# Altium schematic sheet Sheet1.SchDoc
size 420 x 297 mm; SheetNumber: 1; SheetTotal: 1
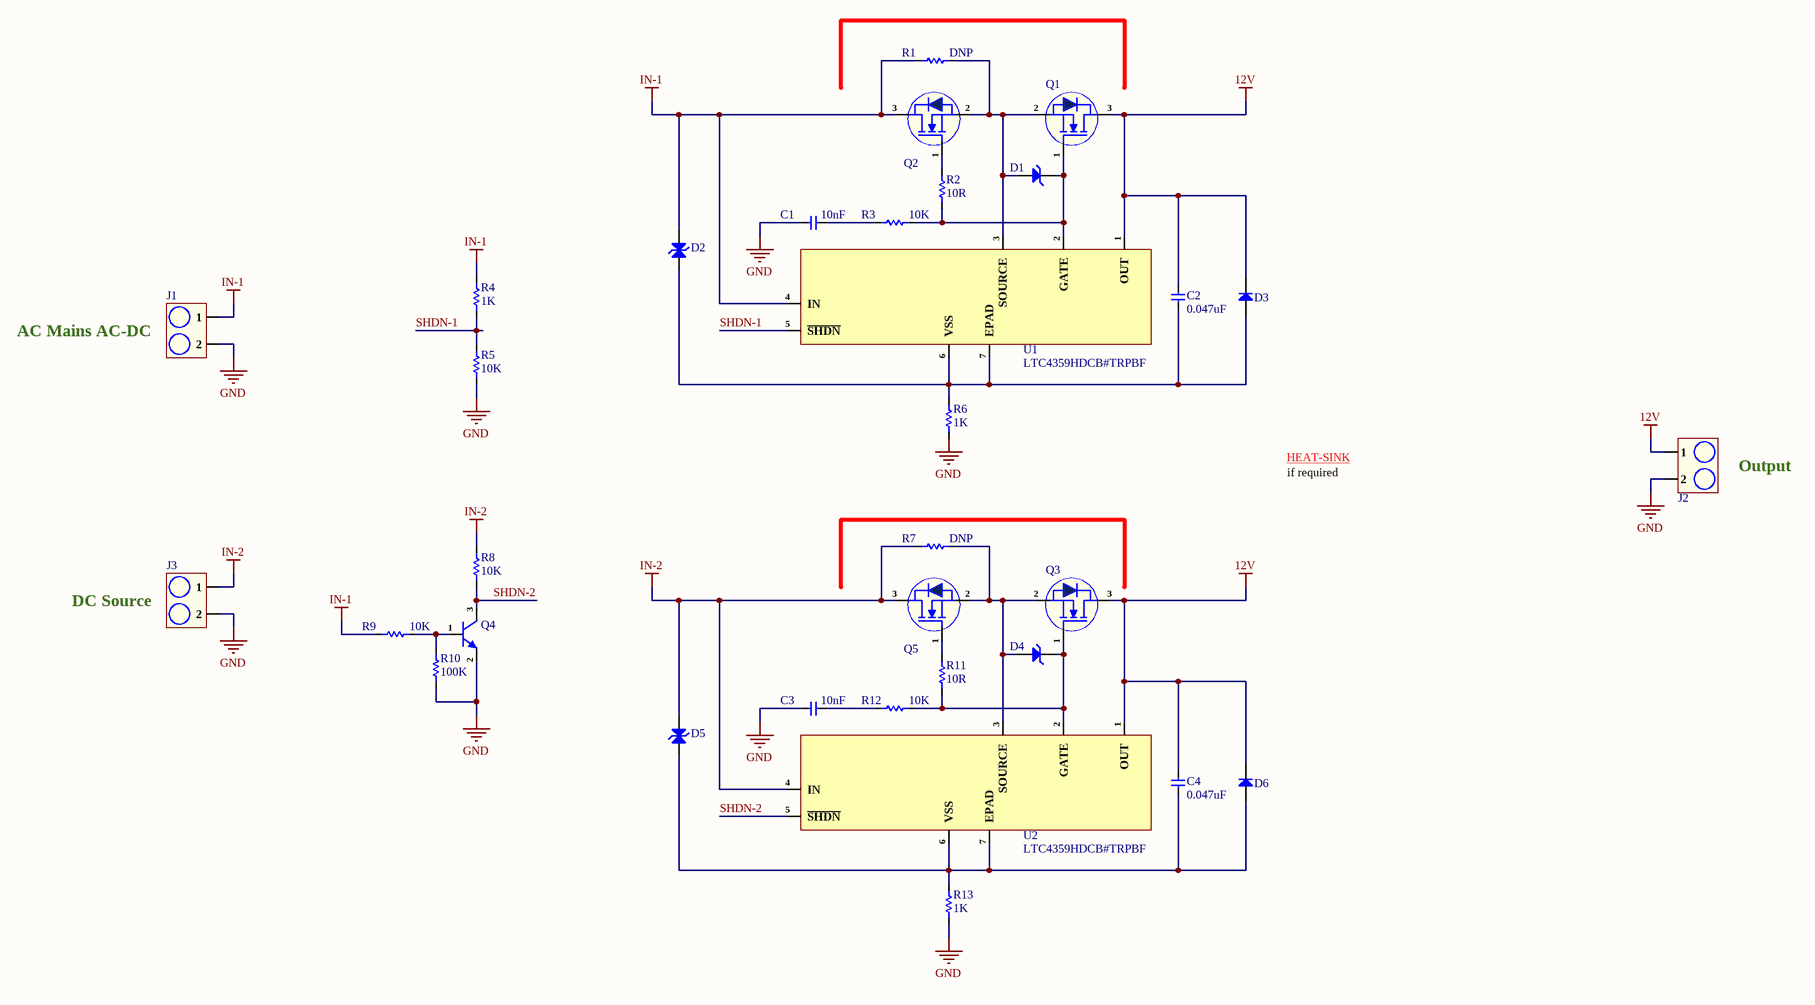
[diagram p0: Sheet1.SchDoc]

## Parts
C1  10nF  [Cap-0402]
C2  0.047uF  [Cap-1206]
C3  10nF  [Cap-0402]
C4  0.047uF  [Cap-1206]
D1  MMSZ5242BS-7-F  [SOD-323]  (value not drawn)
D2  SMAJ24CA  [SMA Bi Directional]  (value not drawn)
D3  S1B-13-F  [SMA(DO-214AC)]  (value not drawn)
D4  MMSZ5242BS-7-F  [SOD-323]  (value not drawn)
D5  SMAJ24CA  [SMA Bi Directional]  (value not drawn)
D6  S1B-13-F  [SMA(DO-214AC)]  (value not drawn)
J1  KF78C-13.0-2P  [KF78C-13.0-2P]  (value not drawn)
J2  KF78C-13.0-2P  [KF78C-13.0-2P]  (value not drawn)
J3  KF78C-13.0-2P  [KF78C-13.0-2P]  (value not drawn)
Q1  AOTL66912  [Tolla]  (value not drawn)
Q2  AOTL66912  [Tolla]  (value not drawn)
Q3  AOTL66912  [Tolla]  (value not drawn)
Q4  MMBTA06-7-F  [SOT-23]  (value not drawn)
Q5  AOTL66912  [Tolla]  (value not drawn)
R1  DNP  [Res-0603]  (no BOM)
R2  10R  [Res-0603]
R3  10K  [Res-0603]
R4  1K  [Res-0603]
R5  10K  [Res-0603]
R6  1K  [Res-0603]
R7  DNP  [Res-0603]  (no BOM)
R8  10K  [Res-0603]
R9  10K  [Res-0603]
R10  100K  [Res-0603]
R11  10R  [Res-0603]
R12  10K  [Res-0603]
R13  1K  [Res-0603]
U1  LTC4359HDCB#TRPBF  [DFN-6-EP(2x3)]
U2  LTC4359HDCB#TRPBF  [DFN-6-EP(2x3)]

## Nets
12V: C2.2 C4.2 D3.1(K) D6.1(K) J2.1 Q1.3(D) Q3.3(D) U1.1(OUT) U2.1(OUT)
GND: C1.1 C3.1 J1.2 J2.2 J3.2 Q4.2(E) R5.1 R6.1 R10.1 R13.1
IN-1: D2.2(K) J1.1 Q2.3(D) R1.2 R4.2 R9.2 U1.4(IN)
IN-2: D5.2(K) J3.1 Q5.3(D) R7.2 R8.1 U2.4(IN)
SHDN-1: R4.1 R5.2 U1.5(~{SHDN})
SHDN-2: Q4.3(C) R8.2 U2.5(~{SHDN})
NetC1_2: C1.2 R3.1
NetC2_1: C2.1 D2.1(A) D3.2(A) R6.2 U1.6(VSS) U1.7(EPAD)
NetC3_2: C3.2 R12.1
NetC4_1: C4.1 D5.1(A) D6.2(A) R13.2 U2.6(VSS) U2.7(EPAD)
NetD1_1: D1.1(K) Q1.1(G) R2.1 R3.2 U1.2(GATE)
NetD1_2: D1.2(A) Q1.2(S) Q2.2(S) R1.1 U1.3(SOURCE)
NetD4_1: D4.1(K) Q3.1(G) R11.1 R12.2 U2.2(GATE)
NetD4_2: D4.2(A) Q3.2(S) Q5.2(S) R7.1 U2.3(SOURCE)
NetQ2_1: Q2.1(G) R2.2
NetQ4_1: Q4.1(B) R9.1 R10.2
NetQ5_1: Q5.1(G) R11.2

## Notes on the sheet
- AC Mains AC-DC
- HEAT-SINK <https://lcsc.com/product-detail/Heat-sink-cooling-fin_XSD-XSD183-097-B_C286209.html>
- if required
- Output
- DC Source
- ZyntelliTech
- File:
- Title:
- Date:
- Page
- Num:
- Total:
- Drawn By: Huzaifa Ali

## Library data of the parts
C1 C3 = CC0402KRX7R0BB103: CAP CER 10000PF 100V X7R 0402; Manufacturer: Yageo; Item Type: Capacitors; Material: Ceramic; Tolerance: 10%; Supplier: Arrow Electronics; LCSC Part Number: C527014; Manufacturer Part Number: CC0402KRX7R0BB103; RoHS: Yes; Stock: 60000; Pricing: 10000=0.0098, 20000=0.0097, 30000=0.0092, 50000=0.0091, 100000=0.009, 250000=0.0089 (USD); Case/Package: 0402; Min Operating Temperature: -55°C; Max Operating Temperature: 125°C; Value: 10nF; Voltage Rating: 100V; Height: 550um; RoHS Compliant: Yes; ComponentLink1URL: https://datasheet.octopart.com/CC0402KRX7R0BB103-Yageo-datasheet-166511530.pdf?src-supplier=Future+Electronics; ComponentLink1Description: https://datasheet.octopart.com/CC0402KRX7R0BB103-Yageo-datasheet-166511530.pdf?src-supplier=Future+Electronics; ComponentLink2URL: https://datasheet.octopart.com/CC0402KRX7R0BB103-Yageo-datasheet-153410991.pdf?src-supplier=Farnell; ComponentLink2Description: https://datasheet.octopart.com/CC0402KRX7R0BB103-Yageo-datasheet-153410991.pdf?src-supplier=Farnell
C2 C4 = CC1206JRX7R0BB473: CAP CER 0.047UF 100V X7R 1206; Manufacturer: Yageo; Tolerance: 5%; Capacitance: 47nF; Item Type: Capacitor; Supplier 1: Arrow Electronics; Manufacturer Part Number: CC1206JRX7R0BB473; RoHS: Yes; Category: Ceramic Capacitors; Stock 1: 6600; Pricing 1: 1=0.21620, 10=0.10530, 25=0.10420, 100=0.08480, 250=0.08390, 500=0.05860, 1000=0.05090, 3000=0.04900, 6000=0.02930 (USD); Mount: Surface Mount; Case/Package: 1206; Case Code (Imperial): 1206; Case Code (Metric): 3216; Min Operating Temperature: -55°C; Max Operating Temperature: 125°C; Packaging: Tape and Reel; Voltage Rating (DC): 100V; Dielectric: X7R; Termination: SMD/SMT; Resistor Type: Ceramic; Voltage Rating: 100V; Series: CC; Construction: Flat; Length: 3.2mm; Width: 1.6mm; Height: 0.85mm; Thickness: 0.037inch; Depth: 1.6mm; Radiation Hardening: No; RoHS Compliant: Yes; ComponentLink1URL: https://datasheet.ciiva.com/11465/upy-np0x7r-mv-100-to-630v-9-11465413.pdf?src-supplier=Avnet; ComponentLink1Description: https://datasheet.ciiva.com/11465/upy-np0x7r-mv-100-to-630v-9-11465413.pdf?src-supplier=Avnet; ComponentLink2URL: https://datasheet.ciiva.com/13210/upy-gp-np0-16v-to-50v-8-13210277.pdf?src-supplier=Mouser; ComponentLink2Description: https://datasheet.ciiva.com/13210/upy-gp-np0-16v-to-50v-8-13210277.pdf?src-supplier=Mouser; Supplier Part Number 1: CC1206JRX7R0BB473; LCSC Part Number: C577197
D1 D4 = MMSZ5242BS-7-F: DIODE ZENER 12V 200MW SOD323; Manufacturer: Diodes; Supplier: Future Electronics; LCSC Part Number: C151457; Manufacturer Part Number: MMSZ5242BS-7-F; RoHS: Yes; Item Type: Diodes; Stock: 15000; Pricing: 3000=0.0228, 9000=0.022, 15000=0.0216, 60000=0.0206, 90000=0.02 (USD); ComponentLink1URL: https://datasheet.ciiva.com/4734/ds31038-62930-4734288.pdf?src-supplier=Mouser; ComponentLink1Description: https://datasheet.ciiva.com/4734/ds31038-62930-4734288.pdf?src-supplier=Mouser; ComponentLink2URL: https://datasheet.ciiva.com/892/ds31038-892105.pdf?src-supplier=Digikey; ComponentLink2Description: https://datasheet.ciiva.com/892/ds31038-892105.pdf?src-supplier=Digikey; ComponentLink3URL: https://datasheet.ciiva.com/892/ds31038-892106.pdf?src-supplier=Digikey; ComponentLink3Description: https://datasheet.ciiva.com/892/ds31038-892106.pdf?src-supplier=Digikey; ComponentLink4URL: https://datasheet.ciiva.com/892/ds31038-892107.pdf?src-supplier=Digikey; ComponentLink4Description: https://datasheet.ciiva.com/892/ds31038-892107.pdf?src-supplier=Digikey; ComponentLink5URL: https://datasheet.ciiva.com/8347/ds31038-8347977.pdf?src-supplier=Avnet; ComponentLink5Description: https://datasheet.ciiva.com/8347/ds31038-8347977.pdf?src-supplier=Avnet
D2 D5 = SMAJ24CA: TVS DIODE 24VWM 38.9VC DO214AC; Manufacturer: Littelfuse; Item Type: TVS Diodes; Peak Pulse Power: 400W; Reverse Standoff Voltage: 24V; Min Breakdown Voltage: 26.7V; Peak Pulse Current: 10.3A; Polarity: Bidirectional; Clamping Voltage: 38.9V; Test Current: 1mA; Number of Bidirectional Channels: 1; Power Line Protection: No; Max Power Dissipation: 3.3W; Leakage Current: 1uA; Diode Type: ZENER; Max Breakdown Voltage: 29.5V; Supplier: Digikey; LCSC Part Number: C148223; Manufacturer Part Number: SMAJ24CA; RoHS: Yes; Stock: 31613; Pricing: 1=0.31, 10=0.21, 100=0.104, 500=0.1, 1000=0.099, 2000=0.09895 (USD); Mounting Technology: Surface Mount; Case/Package: DO-214AC; Pins: 2; Min Operating Temperature: -65°C; Max Operating Temperature: 150°C; Packaging: Tape and Reel; Series: SMAJ; Direction: Bidirectional; Reverse Breakdown Voltage: 26.7V; Number of Elements: 1; Voltage Rating (DC): 24V; Max Reverse Leakage Current: 1uA; Power Dissipation: 400W; Clamping Voltage-Max: 38.9V; Reverse Voltage: 24V; Length: 5.28mm; Width: 2.79mm; Height: 2.29mm; RoHS Compliant: Yes; Lead Free: Lead Free; Reach SVHC Compliant: No; ComponentLink1URL: https://datasheet.ciiva.com/28473/607617-28473406.pdf?src-supplier=Element14; ComponentLink1Description: https://datasheet.ciiva.com/28473/607617-28473406.pdf?src-supplier=Element14; ComponentLink2URL: https://datasheet.ciiva.com/331/littelfuse-tvs-diode-smaj-datasheet-pdf-331049.pdf?src-supplier=Digikey; ComponentLink2Description: https://datasheet.ciiva.com/331/littelfuse-tvs-diode-smaj-datasheet-pdf-331049.pdf?src-supplier=Digikey; ComponentLink3URL: https://datasheet.ciiva.com/331/littelfuse-tvs-diode-smaj-datasheet-pdf-331050.pdf?src-supplier=Digikey; ComponentLink3Description: https://datasheet.ciiva.com/331/littelfuse-tvs-diode-smaj-datasheet-pdf-331050.pdf?src-supplier=Digikey; ComponentLink4URL: https://datasheet.ciiva.com/331/littelfuse-tvs-diode-smaj-datasheet-pdf-331048.pdf?src-supplier=Digikey; ComponentLink4Description: https://datasheet.ciiva.com/331/littelfuse-tvs-diode-smaj-datasheet-pdf-331048.pdf?src-supplier=Digikey
D3 D6 = S1B-13-F: DIODE STANDARD 100V 1A SMA; Manufacturer: Diodes; Supplier: Future Electronics; LCSC Part Number: C156295; Manufacturer Part Number: S1B-13-F; RoHS: Yes; Item Type: Diodes; Stock: 350000; Pricing: 5000=0.0176, 15000=0.0172, 25000=0.017, 100000=0.0165, 150000=0.0162 (USD); ComponentLink1URL: https://datasheet.ciiva.com/911/ds16003-911864.pdf?src-supplier=Digikey; ComponentLink1Description: https://datasheet.ciiva.com/911/ds16003-911864.pdf?src-supplier=Digikey; ComponentLink2URL: https://datasheet.ciiva.com/911/ds16003-911865.pdf?src-supplier=Digikey; ComponentLink2Description: https://datasheet.ciiva.com/911/ds16003-911865.pdf?src-supplier=Digikey; ComponentLink3URL: https://datasheet.ciiva.com/911/ds16003-911866.pdf?src-supplier=Digikey; ComponentLink3Description: https://datasheet.ciiva.com/911/ds16003-911866.pdf?src-supplier=Digikey
J1-J3 = KF78C-13.0-2P: 1x2P Midfoot Barrier Block 2 1 13mm 40A -40℃~+105℃ 750V Black 10~18 Straight pin 6 Plugin,P=13mm Barrier Terminal Blocks ROHS; Manufacturer: CiXi KaiFeng Electronics; Supplier: LCSC; LCSC Part Number: C707721; Manufacturer Part Number: KF78C-13.0-2P; RoHS: No; Item Type: Terminal Block
Q1-Q3 Q5 = AOTL66912: MOSFET N-CH 100V 49A/380A TOLLA; Manufacturer: Alpha & Omega Semiconductor; Continuous Drain Current (ID): 380A; Drain to Source Resistance: 1.4mR; Gate to Source Voltage (Vgs): 20V; Number of Channels: 1NUMBER; Power Dissipation: 8.3W; Turn-Off Delay Time: 90ns; Turn-On Delay Time: 36ns; Supplier: Digikey; LCSC Part Number: C3291324; Manufacturer Part Number: AOTL66912; RoHS: Yes; Item Type: MOSFET; Stock: 5626; Pricing: 1=7.98, 10=5.427, 100=4.1846 (USD); Min Operating Temperature: -55°C; Max Operating Temperature: 175°C; Drain to Source Breakdown Voltage: 100V; Drain to Source Voltage (Vdss): 100V; Height: 2.4mm
Q4 = MMBTA06-7-F: TRANS NPN 80V 0.5A SOT23-3; Manufacturer: Diodes; Item Type: BJTs; Current Rating: 500mA; Supplier: Future Electronics; LCSC Part Number: C151597; Manufacturer Part Number: MMBTA06-7-F; RoHS: Yes; Stock: 573000; Pricing: 3000=0.021, 9000=0.0202, 30000=0.0194, 60000=0.019, 120000=0.0182 (USD); Voltage Rating (DC): 80V; Lead Free: 5697LeadFree; ComponentLink1URL: https://datasheet.ciiva.com/19482/1540800-19482686.pdf?src-supplier=Jameco; ComponentLink1Description: https://datasheet.ciiva.com/19482/1540800-19482686.pdf?src-supplier=Jameco; ComponentLink2URL: https://datasheet.ciiva.com/15139/getdatasheetpartid-116057-15139325.pdf?src-supplier=Verical; ComponentLink2Description: https://datasheet.ciiva.com/15139/getdatasheetpartid-116057-15139325.pdf?src-supplier=Verical; ComponentLink3URL: https://datasheet.ciiva.com/972/ds30037-972971.pdf?src-supplier=Digikey; ComponentLink3Description: https://datasheet.ciiva.com/972/ds30037-972971.pdf?src-supplier=Digikey; ComponentLink4URL: https://datasheet.ciiva.com/972/ds30037-972972.pdf?src-supplier=Digikey; ComponentLink4Description: https://datasheet.ciiva.com/972/ds30037-972972.pdf?src-supplier=Digikey; ComponentLink5URL: https://datasheet.ciiva.com/972/ds30037-972973.pdf?src-supplier=Digikey; ComponentLink5Description: https://datasheet.ciiva.com/972/ds30037-972973.pdf?src-supplier=Digikey; ComponentLink6URL: https://datasheet.ciiva.com/11197/ds30037-11197413.pdf?src-supplier=Avnet; ComponentLink6Description: https://datasheet.ciiva.com/11197/ds30037-11197413.pdf?src-supplier=Avnet; ComponentLink7URL: https://datasheet.ciiva.com/4723/ds30037-4723212.pdf?src-supplier=Mouser; ComponentLink7Description: https://datasheet.ciiva.com/4723/ds30037-4723212.pdf?src-supplier=Mouser; ComponentLink8URL: https://datasheet.ciiva.com/22711/1915521-22711756.pdf?src-supplier=Element14; ComponentLink8Description: https://datasheet.ciiva.com/22711/1915521-22711756.pdf?src-supplier=Element14; ComponentLink9URL: https://datasheet.ciiva.com/16298/ds30037-16298441.pdf?src-supplier=Future+Electronics; ComponentLink9Description: https://datasheet.ciiva.com/16298/ds30037-16298441.pdf?src-supplier=Future+Electronics
R1 R7 R10 = RC0603FR-07100KL: RES 100K OHM 1% 1/10W 0603; Manufacturer: Yageo; Item Type: Resistors; Value: 100kR; Temperature Coefficient: 100ppm/°C; Voltage Rating (DC): 50V; Power Rating: 100mW; Supplier: Rs; LCSC Part Number: C14675; Manufacturer Part Number: RC0603FR-07100KL; RoHS: Yes; Stock: 27300; Case/Package: 0603; Pins: 2; Case Code (Imperial): 0603; Case Code (Metric): 1608; Min Operating Temperature: -55°C; Max Operating Temperature: 155°C; Tolerance: 1%; Resistor Type: Thick Film; Packaging: Tape and Reel; Voltage Rating: 50V; Termination: SMD/SMT; Number of Terminations: 2; Features: Moisture Resistant; Series: RC; Max Power Dissipation: 100mW; Resistance Tolerance: 1%; Construction: Rectangular; Technology: THICK FILM; Length: 1.6mm; Width: 0.8mm; Height: 0.45mm; Depth: 0.8mm; Reach SVHC Compliant: No; Lead Free: 5697LeadFree; Military Standard: Not; RoHS Compliant: Yes; Supplier Part Number: 2424020; Category: Chip SMD Resistors; Mounting Technology: Surface Mount; Weight: 7.1E-05oz; Package Quantity: 5000; ComponentLink1URL: https://datasheet.ciiva.com/11819/0900766b80f96399-11819227.pdf?src-supplier=Rs; ComponentLink1Description: https://datasheet.ciiva.com/11819/0900766b80f96399-11819227.pdf?src-supplier=Rs; ComponentLink2URL: https://datasheet.ciiva.com/2455/pyu-r-int-thick-7-2455183.pdf?src-supplier=Digikey; ComponentLink2Description: https://datasheet.ciiva.com/2455/pyu-r-int-thick-7-2455183.pdf?src-supplier=Digikey; ComponentLink3URL: https://datasheet.ciiva.com/2455/pyu-r-int-thick-7-2455184.pdf?src-supplier=Digikey; ComponentLink3Description: https://datasheet.ciiva.com/2455/pyu-r-int-thick-7-2455184.pdf?src-supplier=Digikey; ComponentLink4URL: https://datasheet.ciiva.com/2455/pyu-r-int-thick-7-2455182.pdf?src-supplier=Digikey; ComponentLink4Description: https://datasheet.ciiva.com/2455/pyu-r-int-thick-7-2455182.pdf?src-supplier=Digikey
R2 R11 = RC0603FR-0710RL: RES SMD 10 OHM 1% 1/10W 0603; Manufacturer: Yageo; Temperature Coefficient: 200ppm/°C; Power Rating: 100mW; Voltage Rating: 50V; Item type: Resistor; Supplier 1: Digi-Key; Manufacturer Part Number: RC0603FR-0710RL; Stock 1: 10836596; Pricing 1: 1=0.1, 10=0.046, 100=0.0187, 1000=0.0084, 2500=0.00729 (USD); Case/Package: 0603; Number of Pins: 2; Case Code (Imperial): 0603; Case Code (Metric): 1608; Contact Plating: Tin,Matte; Min Operating Temperature: -55°C; Max Operating Temperature: 155°C; Resistance: 10R; Tolerance: 1%; Composition: Thick Film; Packaging: Tape and Reel; Voltage Rating (DC): 50V; Termination: SMD/SMT; Military Standard: Not; Length: 1.6mm; Height: 0.45mm; Width: 0.8mm; Depth: 0.8mm; Radiation Hardening: No; Lead Free: Lead Free; REACH SVHC: No SVHC; ComponentLink1URL: http://www.farnell.com/datasheets/1868787.pdf?src-supplier=Element14; ComponentLink1Description: http://www.farnell.com/datasheets/1868787.pdf?src-supplier=Element14; ComponentLink2URL: http://www.yageo.com/documents/recent/PYu-RC0603_51_RoHS_L_4.pdf?src-supplier=Avnet; ComponentLink2Description: http://www.yageo.com/documents/recent/PYu-RC0603_51_RoHS_L_4.pdf?src-supplier=Avnet; ComponentLink3URL: http://documents.rs-components.com/techlib://itc_doclist_GB.htm?stockno=5048984&src-supplier=RSComponents; ComponentLink3Description: http://documents.rs-components.com/techlib://itc_doclist_GB.htm?stockno=5048984&src-supplier=RSComponents; ComponentLink4URL: http://www.yageo.com/documents/recent/PYu-RC0603_51_RoHS_L_4.pdf?src-supplier=Avnet+Europe; ComponentLink4Description: http://www.yageo.com/documents/recent/PYu-RC0603_51_RoHS_L_4.pdf?src-supplier=Avnet+Europe; Supplier Part Number 1: 311-10.0HRDKR-ND; LCSC Part Number: C109318
R3 R5 R8 R9 R12 = RC0603FR-0710KL: RES SMD 10K Ohm 1% 1/10W 0603; Manufacturer: Yageo; Resistance: 10kR; Temperature Coefficient: 100ppm/°C; Voltage Rating (DC): 50V; Power Rating: 100mW; Voltage Rating: 75V; Item Type: Resistor; Supplier 1: Digi-Key; Manufacturer Part Number: RC0603FR-0710KL; RoHS: Yes; Category: Chip SMD Resistors; Stock 1: 25249139; Pricing 1: 1=0.10000, 10=0.02400, 100=0.00970, 1000=0.00436, 2500=0.00378 (USD); Case/Package: 0603; Number of Pins: 2; Case Code (Imperial): 0603; Case Code (Metric): 1608; Weight: 7.1E-05oz; Size Code: 0603; Min Operating Temperature: -55°C; Max Operating Temperature: 155°C; Tolerance: 1%; Resistor Type: Thick Film; Packaging: Tape and Reel; Termination: SMD/SMT; Features: Moisture Resistant; Series: RC; Max Power Dissipation: 100mW; Number of Terminations: 2; Resistance Tolerance: 1%; Construction: Rectangular; Length: 1.6mm; Width: 0.8mm; Height: 0.45mm; Depth: 0.8mm; Lead Pitch: 0.3mm; REACH SVHC: Unknown; Lead Free: Lead Free; Military Standard: Not; RoHS Compliant: Yes; ComponentLink1URL: https://datasheet.ciiva.com/7660/38590-7660789.pdf?src-supplier=Element14; ComponentLink1Description: https://datasheet.ciiva.com/7660/38590-7660789.pdf?src-supplier=Element14; ComponentLink2URL: https://datasheet.ciiva.com/7983/443971-7983596.pdf?src-supplier=Element14; ComponentLink2Description: https://datasheet.ciiva.com/7983/443971-7983596.pdf?src-supplier=Element14; ComponentLink3URL: https://datasheet.ciiva.com/22747/443971-22747519.pdf?src-supplier=Element14; ComponentLink3Description: https://datasheet.ciiva.com/22747/443971-22747519.pdf?src-supplier=Element14; ComponentLink4URL: https://datasheet.ciiva.com/46440/1868787-46440891.pdf?src-supplier=Element14; ComponentLink4Description: https://datasheet.ciiva.com/46440/1868787-46440891.pdf?src-supplier=Element14; ComponentLink5URL: https://datasheet.ciiva.com/7746/1738695-7746239.pdf?src-supplier=Element14; ComponentLink5Description: https://datasheet.ciiva.com/7746/1738695-7746239.pdf?src-supplier=Element14; ComponentLink6URL: https://datasheet.ciiva.com/15189/getdatasheetpartid-409289-15189591.pdf?src-supplier=Verical; ComponentLink6Description: https://datasheet.ciiva.com/15189/getdatasheetpartid-409289-15189591.pdf?src-supplier=Verical; Supplier Part Number 1: 311-10.0KHRCT-ND; LCSC Part Number: C98220
R4 R6 R13 = RC0603FR-071KL: RES SMD 1K OHM 1% 1/10W 0603; Manufacturer: Yageo; Resistance: 1kR; Temperature Coefficient: 100ppm/°C; Power Rating: 100mW; Voltage Rating: 50V; Item type: Resistor; ComponentLink1URL: https://www.verical.com/server-webapp/html/getDatasheet?partID=409289&src-supplier=Verical; ComponentLink1Description: https://www.verical.com/server-webapp/html/getDatasheet?partID=409289&src-supplier=Verical; Supplier 1: Digi-Key; Manufacturer Part Number: RC0603FR-071KL; Stock 1: 21472395; Pricing 1: 1=0.1, 10=0.023, 100=0.0094, 1000=0.0042, 2500=0.0037 (USD); Case/Package: 0603; Contact Plating: Tin,Matte; Case Code (Imperial): 0603; Case Code (Metric): 1608; Min Operating Temperature: -55°C; Max Operating Temperature: 155°C; Tolerance: 1%; Composition: Thick Film; Packaging: Tape and Reel; Termination: SMD/SMT; Military Standard: Not; Length: 1.6mm; Height: 0.45mm; Depth: 0.8mm; Radiation Hardening: No; REACH SVHC: No SVHC; Lead Free: Lead Free; ComponentLink2URL: http://documents.rs-components.com/techlib://itc_doclist_GB.htm?stockno=5048928&src-supplier=RSComponents; ComponentLink2Description: http://documents.rs-components.com/techlib://itc_doclist_GB.htm?stockno=5048928&src-supplier=RSComponents; ComponentLink3URL: http://www.yageo.com/documents/recent/PYu-RC0603_51_RoHS_L_4.pdf?src-supplier=Avnet+Europe; ComponentLink3Description: http://www.yageo.com/documents/recent/PYu-RC0603_51_RoHS_L_4.pdf?src-supplier=Avnet+Europe; ComponentLink4URL: http://www.farnell.com/datasheets/2167052.pdf?src-supplier=Element14; ComponentLink4Description: http://www.farnell.com/datasheets/2167052.pdf?src-supplier=Element14; ComponentLink5URL: http://www.farnell.com/datasheets/1868787.pdf?src-supplier=Element14; ComponentLink5Description: http://www.farnell.com/datasheets/1868787.pdf?src-supplier=Element14; ComponentLink6URL: http://www.yageo.com/documents/recent/PYu-RC_Group_51_RoHS_L_2.pdf?src-supplier=Avnet; ComponentLink6Description: http://www.yageo.com/documents/recent/PYu-RC_Group_51_RoHS_L_2.pdf?src-supplier=Avnet; ComponentLink7URL: https://www.verical.com/server-webapp/html/getDatasheet?partID=404327&src-supplier=Verical; ComponentLink7Description: https://www.verical.com/server-webapp/html/getDatasheet?partID=404327&src-supplier=Verical; ComponentLink8URL: http://www.farnell.com/datasheets/443971.pdf?src-supplier=Element14; ComponentLink8Description: http://www.farnell.com/datasheets/443971.pdf?src-supplier=Element14; Supplier Part Number 1: 311-1.00KHRDKR-ND; LCSC Part Number: C22548
U1 U2 = LTC4359HDCB#TRPBF: IC OR CTRLR N+1 6DFN; Manufacturer: Analog Devices / Linear Technology; Supplier: Mouser; LCSC Part Number: C688238; Manufacturer Part Number: LTC4359HDCB#TRPBF; RoHS: Yes; Item Type: IC; Stock: 1133; Pricing: 1=9.31, 10=6.3, 50=5.51, 100=4.62, 1000=4.17, 10000=4.16 (USD); ComponentLink1URL: https://datasheet.ciiva.com/6609/4359fb-6609308.pdf?src-supplier=Digikey; ComponentLink1Description: https://datasheet.ciiva.com/6609/4359fb-6609308.pdf?src-supplier=Digikey